# Altium schematic sheet 00_TOP_LEVEL.SchDoc
size A3; SheetNumber: 1; SheetTotal: 4
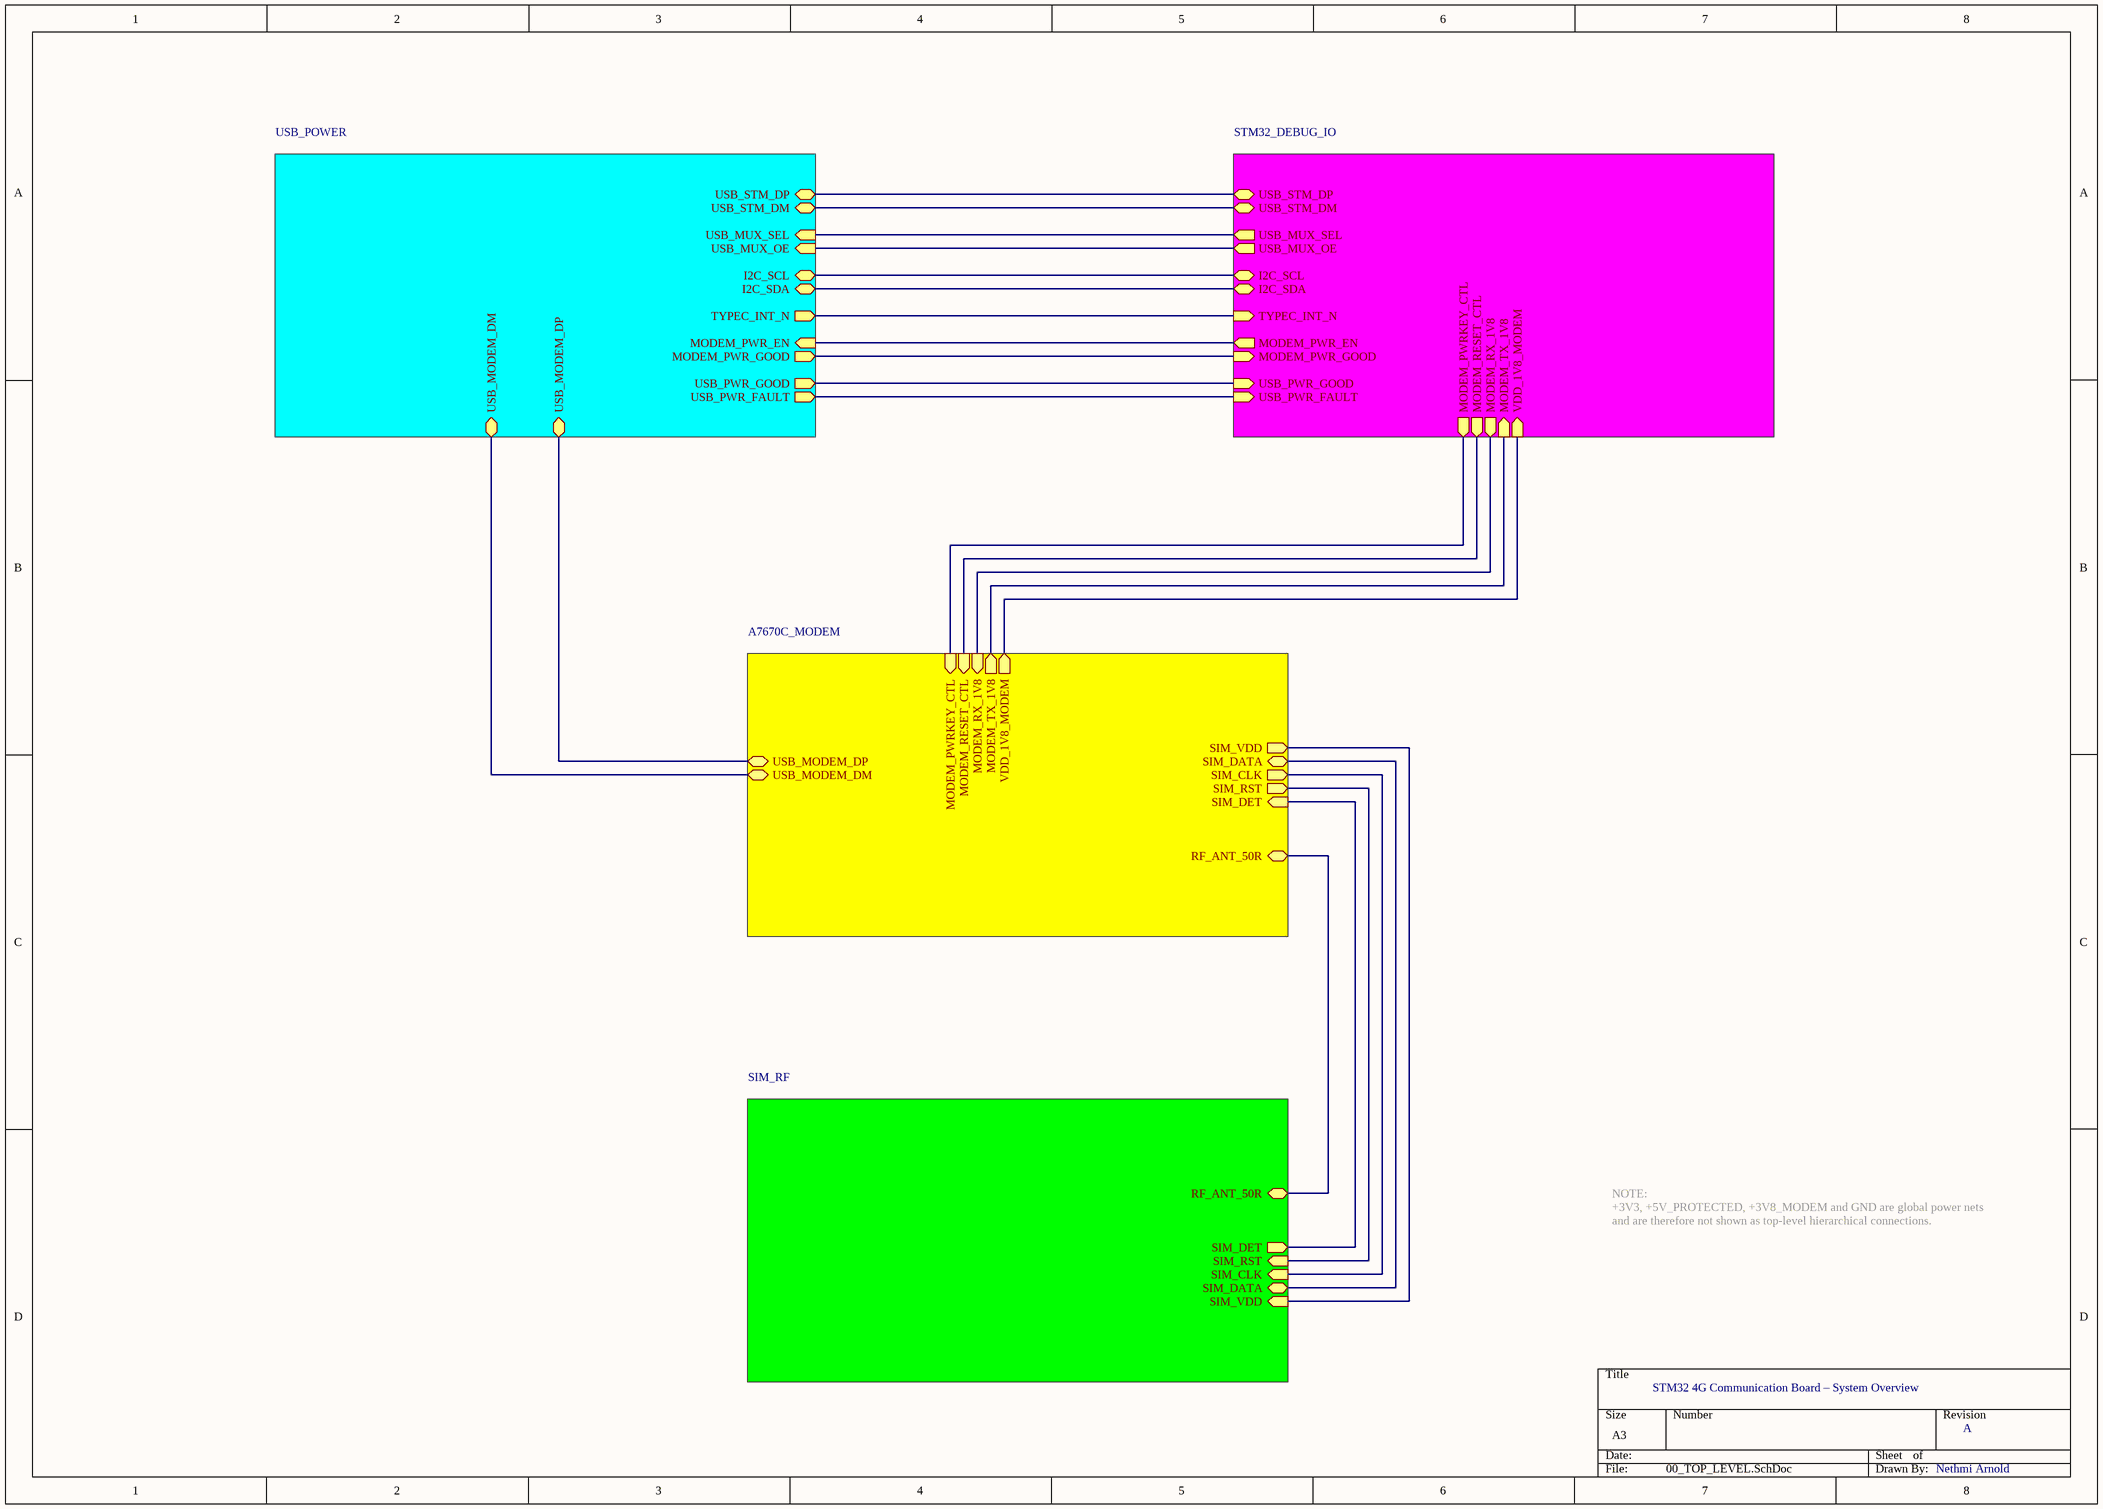
[diagram p0: 00_TOP_LEVEL.SchDoc]

## Sub-sheets
A7670C_MODEM = 03_A7670C_MODEM: SIM_DET (in), SIM_RST (out), SIM_CLK (out), SIM_DATA (bidir), SIM_VDD (out), MODEM_PWRKEY_CTL (in), MODEM_RESET_CTL (in), MODEM_RX_1V8 (in), MODEM_TX_1V8 (out), VDD_1V8_MODEM (out), RF_ANT_50R (bidir), USB_MODEM_DM (bidir), USB_MODEM_DP (bidir)
SIM_RF = 04_SIM_RF: SIM_VDD (in), SIM_DATA (bidir), SIM_CLK (in), SIM_RST (in), SIM_DET (out), RF_ANT_50R (bidir)
STM32_DEBUG_IO = 02_STM32_DEBUG_IO: VDD_1V8_MODEM (in), MODEM_TX_1V8 (in), MODEM_RX_1V8 (out), MODEM_RESET_CTL (out), MODEM_PWRKEY_CTL (out), USB_PWR_FAULT (in), USB_PWR_GOOD (in), MODEM_PWR_GOOD (in), MODEM_PWR_EN (out), I2C_SDA (bidir), I2C_SCL (bidir), USB_MUX_OE (out), USB_MUX_SEL (out), USB_STM_DM (bidir), USB_STM_DP (bidir), TYPEC_INT_N (in)
USB_POWER = 01_USB_POWER: USB_STM_DM (bidir), USB_MUX_SEL (in), USB_MUX_OE (in), I2C_SCL (bidir), I2C_SDA (bidir), TYPEC_INT_N (out), USB_PWR_GOOD (out), USB_PWR_FAULT (out), USB_STM_DP (bidir), MODEM_PWR_GOOD (out), MODEM_PWR_EN (in), USB_MODEM_DP (bidir), USB_MODEM_DM (bidir)

## Nets
(unnamed): sheet USB_POWER/USB_STM_DM, sheet STM32_DEBUG_IO/USB_STM_DM
(unnamed): sheet USB_POWER/USB_MUX_SEL, sheet STM32_DEBUG_IO/USB_MUX_SEL
(unnamed): sheet USB_POWER/USB_MUX_OE, sheet STM32_DEBUG_IO/USB_MUX_OE
(unnamed): sheet USB_POWER/I2C_SCL, sheet STM32_DEBUG_IO/I2C_SCL
(unnamed): sheet USB_POWER/I2C_SDA, sheet STM32_DEBUG_IO/I2C_SDA
(unnamed): sheet USB_POWER/TYPEC_INT_N, sheet STM32_DEBUG_IO/TYPEC_INT_N
(unnamed): sheet USB_POWER/USB_PWR_GOOD, sheet STM32_DEBUG_IO/USB_PWR_GOOD
(unnamed): sheet USB_POWER/USB_PWR_FAULT, sheet STM32_DEBUG_IO/USB_PWR_FAULT
(unnamed): sheet USB_POWER/USB_STM_DP, sheet STM32_DEBUG_IO/USB_STM_DP
(unnamed): sheet USB_POWER/MODEM_PWR_GOOD, sheet STM32_DEBUG_IO/MODEM_PWR_GOOD
(unnamed): sheet USB_POWER/MODEM_PWR_EN, sheet STM32_DEBUG_IO/MODEM_PWR_EN
(unnamed): sheet USB_POWER/USB_MODEM_DP, sheet A7670C_MODEM/USB_MODEM_DP
(unnamed): sheet USB_POWER/USB_MODEM_DM, sheet A7670C_MODEM/USB_MODEM_DM
(unnamed): sheet STM32_DEBUG_IO/VDD_1V8_MODEM, sheet A7670C_MODEM/VDD_1V8_MODEM
(unnamed): sheet STM32_DEBUG_IO/MODEM_TX_1V8, sheet A7670C_MODEM/MODEM_TX_1V8
(unnamed): sheet STM32_DEBUG_IO/MODEM_RX_1V8, sheet A7670C_MODEM/MODEM_RX_1V8
(unnamed): sheet STM32_DEBUG_IO/MODEM_RESET_CTL, sheet A7670C_MODEM/MODEM_RESET_CTL
(unnamed): sheet STM32_DEBUG_IO/MODEM_PWRKEY_CTL, sheet A7670C_MODEM/MODEM_PWRKEY_CTL
(unnamed): sheet A7670C_MODEM/SIM_DET, sheet SIM_RF/SIM_DET
(unnamed): sheet A7670C_MODEM/SIM_RST, sheet SIM_RF/SIM_RST
(unnamed): sheet A7670C_MODEM/SIM_CLK, sheet SIM_RF/SIM_CLK
(unnamed): sheet A7670C_MODEM/SIM_DATA, sheet SIM_RF/SIM_DATA
(unnamed): sheet A7670C_MODEM/SIM_VDD, sheet SIM_RF/SIM_VDD
(unnamed): sheet A7670C_MODEM/RF_ANT_50R, sheet SIM_RF/RF_ANT_50R

## Notes on the sheet
- NOTE:
  +3V3, +5V_PROTECTED, +3V8_MODEM and GND are global power nets
  and are therefore not shown as top-level hierarchical connections.
- STM32 4G Communication Board – System Overview
- A
- Nethmi Arnold